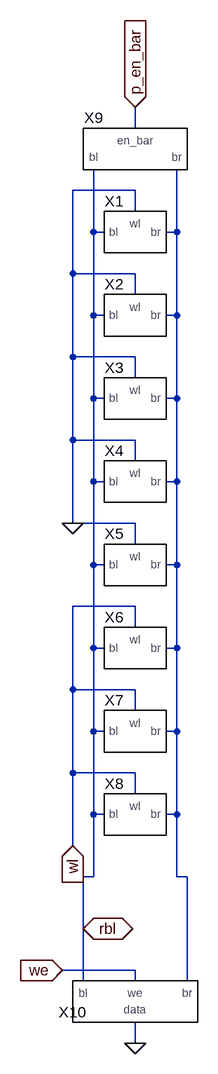
[diagram p0: schematic replica_array.asc]
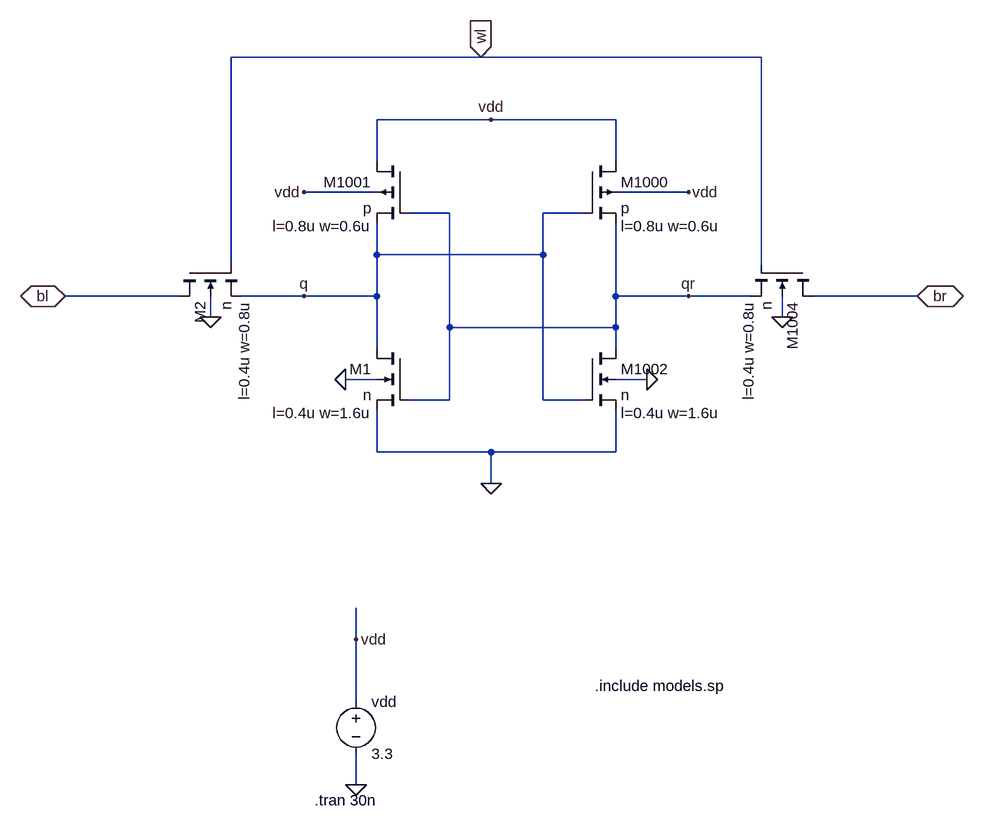
[diagram p1: sub-circuit cell_1rw.asc]
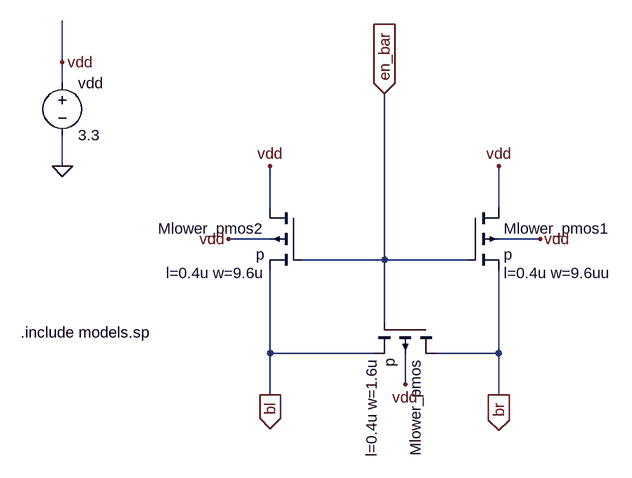
[diagram p2: sub-circuit precharge.asc]
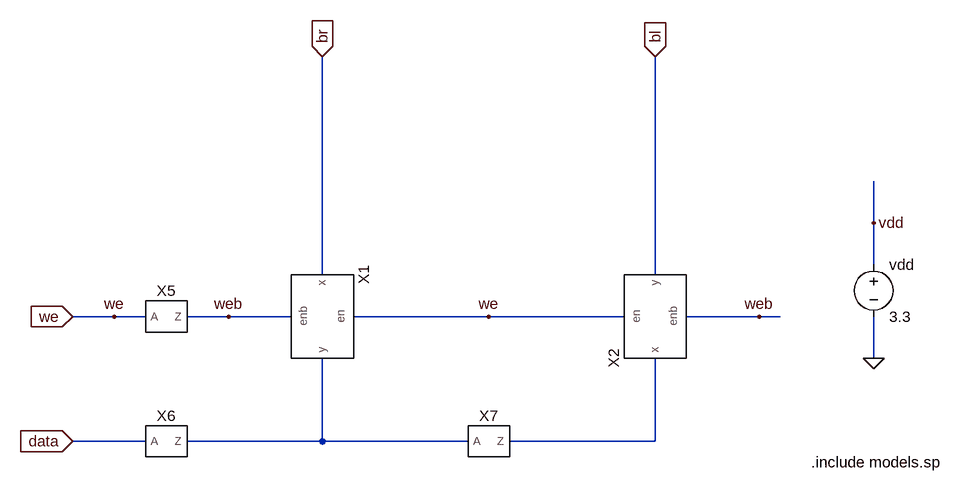
[diagram p3: sub-circuit write_driver.asc]
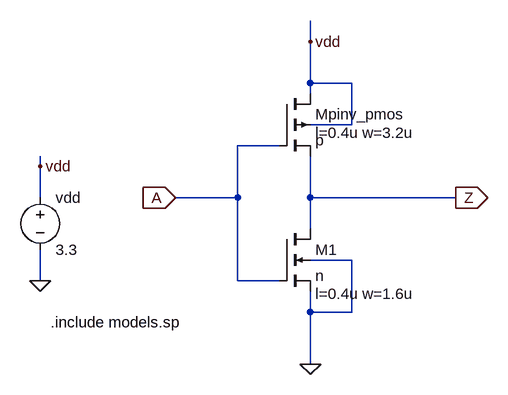
[diagram p4: sub-circuit inv.asc]
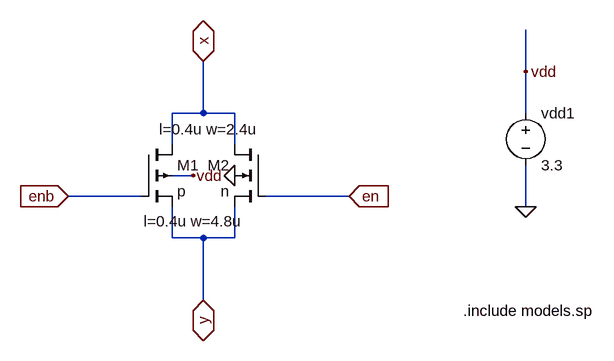
[diagram p5: sub-circuit tri_gate.asc]
replica_array.asc, the LTspice schematic file:
Version 4
SHEET 1 880 932
WIRE 128 -496 128 -528
WIRE 128 -400 32 -400
WIRE 128 -368 128 -400
WIRE 64 -336 64 -432
WIRE 80 -336 64 -336
WIRE 192 -336 192 -432
WIRE 192 -336 176 -336
WIRE 32 -272 32 -400
WIRE 128 -272 32 -272
WIRE 128 -240 128 -272
WIRE 64 -208 64 -336
WIRE 80 -208 64 -208
WIRE 192 -208 192 -336
WIRE 192 -208 176 -208
WIRE 32 -144 32 -272
WIRE 128 -144 32 -144
WIRE 128 -112 128 -144
WIRE 64 -80 64 -208
WIRE 80 -80 64 -80
WIRE 192 -80 192 -208
WIRE 192 -80 176 -80
WIRE 32 -16 32 -144
WIRE 128 -16 32 -16
WIRE 128 16 128 -16
WIRE 64 48 64 -80
WIRE 80 48 64 48
WIRE 192 48 192 -80
WIRE 192 48 176 48
WIRE 32 112 32 -16
WIRE 128 112 32 112
WIRE 128 144 128 112
WIRE 64 176 64 48
WIRE 80 176 64 176
WIRE 192 176 192 48
WIRE 192 176 176 176
WIRE 128 240 32 240
WIRE 128 272 128 240
WIRE 64 304 64 176
WIRE 80 304 64 304
WIRE 192 304 192 176
WIRE 192 304 176 304
WIRE 32 368 32 240
WIRE 128 368 32 368
WIRE 128 400 128 368
WIRE 64 432 64 304
WIRE 80 432 64 432
WIRE 192 432 192 304
WIRE 192 432 176 432
WIRE 32 496 32 368
WIRE 128 496 32 496
WIRE 128 528 128 496
WIRE 64 560 64 432
WIRE 80 560 64 560
WIRE 192 560 192 432
WIRE 192 560 176 560
WIRE 32 608 32 496
WIRE 64 656 64 560
WIRE 64 656 48 656
WIRE 192 656 192 560
WIRE 208 656 192 656
WIRE 48 736 48 656
WIRE 128 800 16 800
WIRE 48 816 48 736
WIRE 128 816 128 800
WIRE 208 816 208 656
WIRE 128 912 128 880
FLAG 128 912 0
FLAG 32 112 0
FLAG 16 800 we
IOPIN 16 800 In
FLAG 32 608 wl
IOPIN 32 608 In
FLAG 48 736 rbl
IOPIN 48 736 BiDir
FLAG 128 -528 p_en_bar
IOPIN 128 -528 In
SYMBOL cell_1rw 128 -336 R0
SYMATTR InstName X1
SYMBOL cell_1rw 128 -208 R0
SYMATTR InstName X2
SYMBOL cell_1rw 128 -80 R0
SYMATTR InstName X3
SYMBOL cell_1rw 128 48 R0
SYMATTR InstName X4
SYMBOL cell_1rw 128 176 R0
SYMATTR InstName X5
SYMBOL cell_1rw 128 304 R0
SYMATTR InstName X6
SYMBOL cell_1rw 128 432 R0
SYMATTR InstName X7
SYMBOL cell_1rw 128 560 R0
SYMATTR InstName X8
SYMBOL precharge 128 -464 R0
SYMATTR InstName X9
SYMBOL write_driver 128 848 R0
SYMATTR InstName X10

cell_1rw.asc, the sub-circuit schematic file:
Version 4
SHEET 1 916 1080
WIRE 160 -80 -224 -80
WIRE 592 -80 160 -80
WIRE 176 16 0 16
WIRE 368 16 176 16
WIRE 0 80 0 16
WIRE 368 80 368 16
WIRE 0 128 -112 128
WIRE 480 128 368 128
WIRE 112 160 48 160
WIRE 320 160 256 160
WIRE 0 224 0 176
WIRE 256 224 256 160
WIRE 256 224 0 224
WIRE -224 240 -224 -80
WIRE 592 240 592 -80
WIRE -304 288 -480 288
WIRE -112 288 -208 288
WIRE 0 288 0 224
WIRE 0 288 -112 288
WIRE 368 288 368 176
WIRE 480 288 368 288
WIRE 576 288 480 288
WIRE 832 288 672 288
WIRE -256 320 -256 288
WIRE 624 320 624 288
WIRE 112 336 112 160
WIRE 368 336 368 288
WIRE 368 336 112 336
WIRE 0 368 0 288
WIRE 368 368 368 336
WIRE 0 416 -48 416
WIRE 416 416 368 416
WIRE 112 448 112 336
WIRE 112 448 48 448
WIRE 256 448 256 224
WIRE 320 448 256 448
WIRE 0 528 0 464
WIRE 176 528 0 528
WIRE 368 528 368 464
WIRE 368 528 176 528
WIRE 176 576 176 528
WIRE -32 816 -32 768
WIRE -32 912 -32 816
WIRE -32 1040 -32 992
FLAG 176 576 0
FLAG -32 1040 0
FLAG -32 816 vdd
FLAG 176 16 vdd
FLAG 416 416 0
FLAG -48 416 0
FLAG 624 320 0
FLAG -256 320 0
FLAG -112 128 vdd
FLAG 480 128 vdd
FLAG -480 288 bl
IOPIN -480 288 BiDir
FLAG 160 -80 wl
IOPIN 160 -80 In
FLAG 832 288 br
IOPIN 832 288 BiDir
FLAG -112 288 q
FLAG 480 288 qr
SYMBOL pmos4 320 80 R0
WINDOW 123 56 100 Left 2
SYMATTR Value2 l=0.8u w=0.6u
SYMATTR InstName M1000
SYMATTR Value p
SYMBOL pmos4 48 80 M0
WINDOW 123 56 100 Left 2
SYMATTR Value2 l=0.8u w=0.6u
SYMATTR InstName M1001
SYMATTR Value p
SYMBOL nmos4 320 368 R0
WINDOW 123 56 100 Left 2
SYMATTR Value2 l=0.4u w=1.6u
SYMATTR InstName M1002
SYMATTR Value n
SYMBOL nmos4 48 368 M0
WINDOW 123 56 100 Left 2
SYMATTR Value2 l=0.4u w=1.6u
SYMATTR InstName M1
SYMATTR Value n
SYMBOL voltage -32 896 R0
WINDOW 123 0 0 Left 0
WINDOW 39 0 0 Left 0
SYMATTR InstName vdd
SYMATTR Value 3.3
SYMBOL nmos4 672 240 R90
WINDOW 123 56 100 Left 2
SYMATTR Value2 l=0.4u w=0.8u
SYMATTR InstName M1004
SYMATTR Value n
SYMBOL nmos4 -304 240 M90
WINDOW 123 56 100 Left 2
SYMATTR Value2 l=0.4u w=0.8u
SYMATTR InstName M2
SYMATTR Value n
TEXT 336 888 Left 2 !.include models.sp
TEXT -96 1064 Left 2 !.tran 30n

precharge.asc, the sub-circuit schematic file:
Version 4
SHEET 1 880 680
WIRE -448 -64 -448 -128
WIRE -448 -32 -448 -64
WIRE -448 96 -448 48
WIRE -128 160 -128 96
WIRE 224 160 224 96
WIRE -128 208 -192 208
WIRE 288 208 224 208
WIRE 48 240 48 -16
WIRE 48 240 -80 240
WIRE 176 240 48 240
WIRE 48 336 48 240
WIRE -128 384 -128 256
WIRE 32 384 -128 384
WIRE 224 384 224 256
WIRE 224 384 128 384
WIRE 80 432 80 384
WIRE -128 448 -128 384
WIRE 224 448 224 384
FLAG -448 96 0
FLAG 288 208 vdd
FLAG -192 208 vdd
FLAG 80 432 vdd
FLAG 224 96 vdd
FLAG -128 96 vdd
FLAG -128 448 bl
IOPIN -128 448 Out
FLAG 224 448 br
IOPIN 224 448 Out
FLAG 48 -16 en_bar
IOPIN 48 -16 In
FLAG -448 -64 vdd
SYMBOL pmos4 128 336 R90
WINDOW 123 56 100 Left 2
SYMATTR Value2 l=0.4u w=1.6u
SYMATTR InstName Mlower_pmos
SYMATTR Value p
SYMBOL pmos4 176 160 R0
WINDOW 123 56 100 Left 2
SYMATTR Value2 l=0.4u w=9.6uu
SYMATTR InstName Mlower_pmos1
SYMATTR Value p
SYMBOL pmos4 -80 160 M0
WINDOW 123 56 100 Left 2
SYMATTR Value2 l=0.4u w=9.6u
SYMATTR InstName Mlower_pmos2
SYMATTR Value p
SYMBOL voltage -448 -48 R0
SYMATTR InstName vdd
SYMATTR Value 3.3
TEXT -512 352 Left 2 !.include models.sp

write_driver.asc, the sub-circuit schematic file:
Version 4
SHEET 1 880 680
WIRE 624 -624 624 -688
WIRE 624 -560 624 -624
WIRE -224 -544 -224 -880
WIRE 288 -544 288 -880
WIRE -544 -480 -608 -480
WIRE -496 -480 -544 -480
WIRE -368 -480 -432 -480
WIRE -272 -480 -368 -480
WIRE 32 -480 -176 -480
WIRE 240 -480 32 -480
WIRE 448 -480 336 -480
WIRE 480 -480 448 -480
WIRE 624 -416 624 -480
WIRE -496 -288 -608 -288
WIRE -224 -288 -224 -416
WIRE -224 -288 -432 -288
WIRE 0 -288 -224 -288
WIRE 288 -288 288 -416
WIRE 288 -288 64 -288
FLAG 624 -416 0
FLAG 624 -624 vdd
FLAG -608 -480 we
IOPIN -608 -480 In
FLAG -608 -288 data
IOPIN -608 -288 In
FLAG -224 -880 br
IOPIN -224 -880 In
FLAG 288 -880 bl
IOPIN 288 -880 In
FLAG -368 -480 web
FLAG 32 -480 we
FLAG -544 -480 we
FLAG 448 -480 web
SYMBOL voltage 624 -576 R0
WINDOW 123 0 0 Left 0
WINDOW 39 0 0 Left 0
SYMATTR InstName vdd
SYMATTR Value 3.3
SYMBOL inv -464 -480 R0
SYMATTR InstName X5
SYMBOL inv -464 -288 R0
SYMATTR InstName X6
SYMBOL inv 32 -288 R0
SYMATTR InstName X7
SYMBOL tri_gate -224 -480 R90
SYMATTR InstName X1
SYMBOL tri_gate 288 -480 R270
SYMATTR InstName X2
TEXT 528 -256 Left 2 !.include models.sp

inv.asc, the sub-circuit schematic file:
Version 4
SHEET 1 880 680
WIRE 112 -128 112 -160
WIRE 112 -64 112 -128
WIRE 176 -64 112 -64
WIRE 112 -48 112 -64
WIRE 176 0 176 -64
WIRE 176 0 112 0
WIRE 64 32 0 32
WIRE -304 64 -304 48
WIRE -304 112 -304 64
WIRE 0 112 0 32
WIRE 0 112 -96 112
WIRE 112 112 112 48
WIRE 336 112 112 112
WIRE 112 160 112 112
WIRE 176 208 112 208
WIRE -304 240 -304 192
WIRE 0 240 0 112
WIRE 64 240 0 240
WIRE 112 288 112 256
WIRE 176 288 176 208
WIRE 176 288 112 288
WIRE 112 368 112 288
FLAG -96 112 A
IOPIN -96 112 In
FLAG 336 112 Z
IOPIN 336 112 Out
FLAG 112 368 0
FLAG -304 240 0
FLAG 112 -128 vdd
FLAG -304 64 vdd
SYMBOL nmos4 64 160 R0
WINDOW 123 56 100 Left 2
SYMATTR Value2 l=0.4u w=1.6u
SYMATTR InstName M1
SYMATTR Value n
SYMBOL pmos4 64 -48 R0
WINDOW 123 56 60 Left 2
SYMATTR Value2 l=0.4u w=3.2u
SYMATTR InstName Mpinv_pmos
SYMATTR Value p
SYMBOL voltage -304 96 R0
SYMATTR InstName vdd
SYMATTR Value 3.3
TEXT -288 304 Left 2 !.include models.sp

tri_gate.asc, the sub-circuit schematic file:
Version 4
SHEET 1 880 680
WIRE 576 -16 576 -80
WIRE 80 48 80 -32
WIRE 80 48 32 48
WIRE 128 48 80 48
WIRE 576 48 576 -16
WIRE 32 96 32 48
WIRE 128 96 128 48
WIRE 64 144 32 144
WIRE -16 176 -128 176
WIRE 304 176 176 176
WIRE 576 192 576 128
WIRE 32 240 32 192
WIRE 80 240 32 240
WIRE 128 240 128 192
WIRE 128 240 80 240
WIRE 80 336 80 240
FLAG 128 144 0
FLAG 64 144 vdd
FLAG 576 192 0
FLAG 576 -16 vdd
FLAG 80 336 y
IOPIN 80 336 BiDir
FLAG 80 -32 x
IOPIN 80 -32 BiDir
FLAG 304 176 en
IOPIN 304 176 In
FLAG -128 176 enb
IOPIN -128 176 In
SYMBOL pmos4 -16 96 R0
WINDOW 123 4 118 Left 2
SYMATTR Value2 l=0.4u w=4.8u
SYMATTR InstName M1
SYMATTR Value p
SYMBOL nmos4 176 96 M0
WINDOW 123 12 -23 Left 2
SYMATTR Value2 l=0.4u w=2.4u
SYMATTR InstName M2
SYMATTR Value n
SYMBOL voltage 576 32 R0
WINDOW 123 0 0 Left 0
WINDOW 39 0 0 Left 0
SYMATTR InstName vdd1
SYMATTR Value 3.3
TEXT 480 352 Left 2 !.include models.sp

The netlist it stands for:
* replica_array.asc
XX1 0 rbl N001 cell_1rw
XX2 0 rbl N001 cell_1rw
XX3 0 rbl N001 cell_1rw
XX4 0 rbl N001 cell_1rw
XX5 0 rbl N001 cell_1rw
XX6 wl rbl N001 cell_1rw
XX7 wl rbl N001 cell_1rw
XX8 wl rbl N001 cell_1rw
XX9 p_en_bar rbl N001 precharge
XX10 rbl N001 0 we write_driver

* block symbol definitions
.subckt cell_1rw wl bl br
M1000 vdd q qr vdd p l=0.8u w=0.6u
M1001 vdd qr q vdd p l=0.8u w=0.6u
M1002 qr q 0 0 n l=0.4u w=1.6u
M1 q qr 0 0 n l=0.4u w=1.6u
vdd vdd 0 3.3
M1004 br wl qr 0 n l=0.4u w=0.8u
M2 bl wl q 0 n l=0.4u w=0.8u
.include models.sp
.tran 30n
.ends cell_1rw

.subckt precharge en_bar bl br
Mlower_pmos br en_bar bl vdd p l=0.4u w=1.6u
Mlower_pmos1 vdd en_bar br vdd p l=0.4u w=9.6uu
Mlower_pmos2 vdd en_bar bl vdd p l=0.4u w=9.6u
vdd vdd 0 3.3
.include models.sp
.ends precharge

.subckt write_driver bl br data we
vdd vdd 0 3.3
XX5 we web inv
XX6 data N001 inv
XX7 N001 N002 inv
XX1 we web br N001 tri_gate
XX2 we web N002 bl tri_gate
.include models.sp
.ends write_driver

.subckt inv A Z
M1 Z A 0 0 n l=0.4u w=1.6u
Mpinv_pmos vdd A Z vdd p l=0.4u w=3.2u
vdd vdd 0 3.3
.include models.sp
.ends inv

.subckt tri_gate en enb x y
M1 x enb y vdd p l=0.4u w=4.8u
M2 x en y 0 n l=0.4u w=2.4u
vdd1 vdd 0 3.3
.include models.sp
.ends tri_gate

.model NMOS NMOS
.model PMOS PMOS
.lib standard.mos
.backanno
.end